# Altium schematic sheet 03_10_POWER_INPUT.SchDoc
size 289 x 400 mm
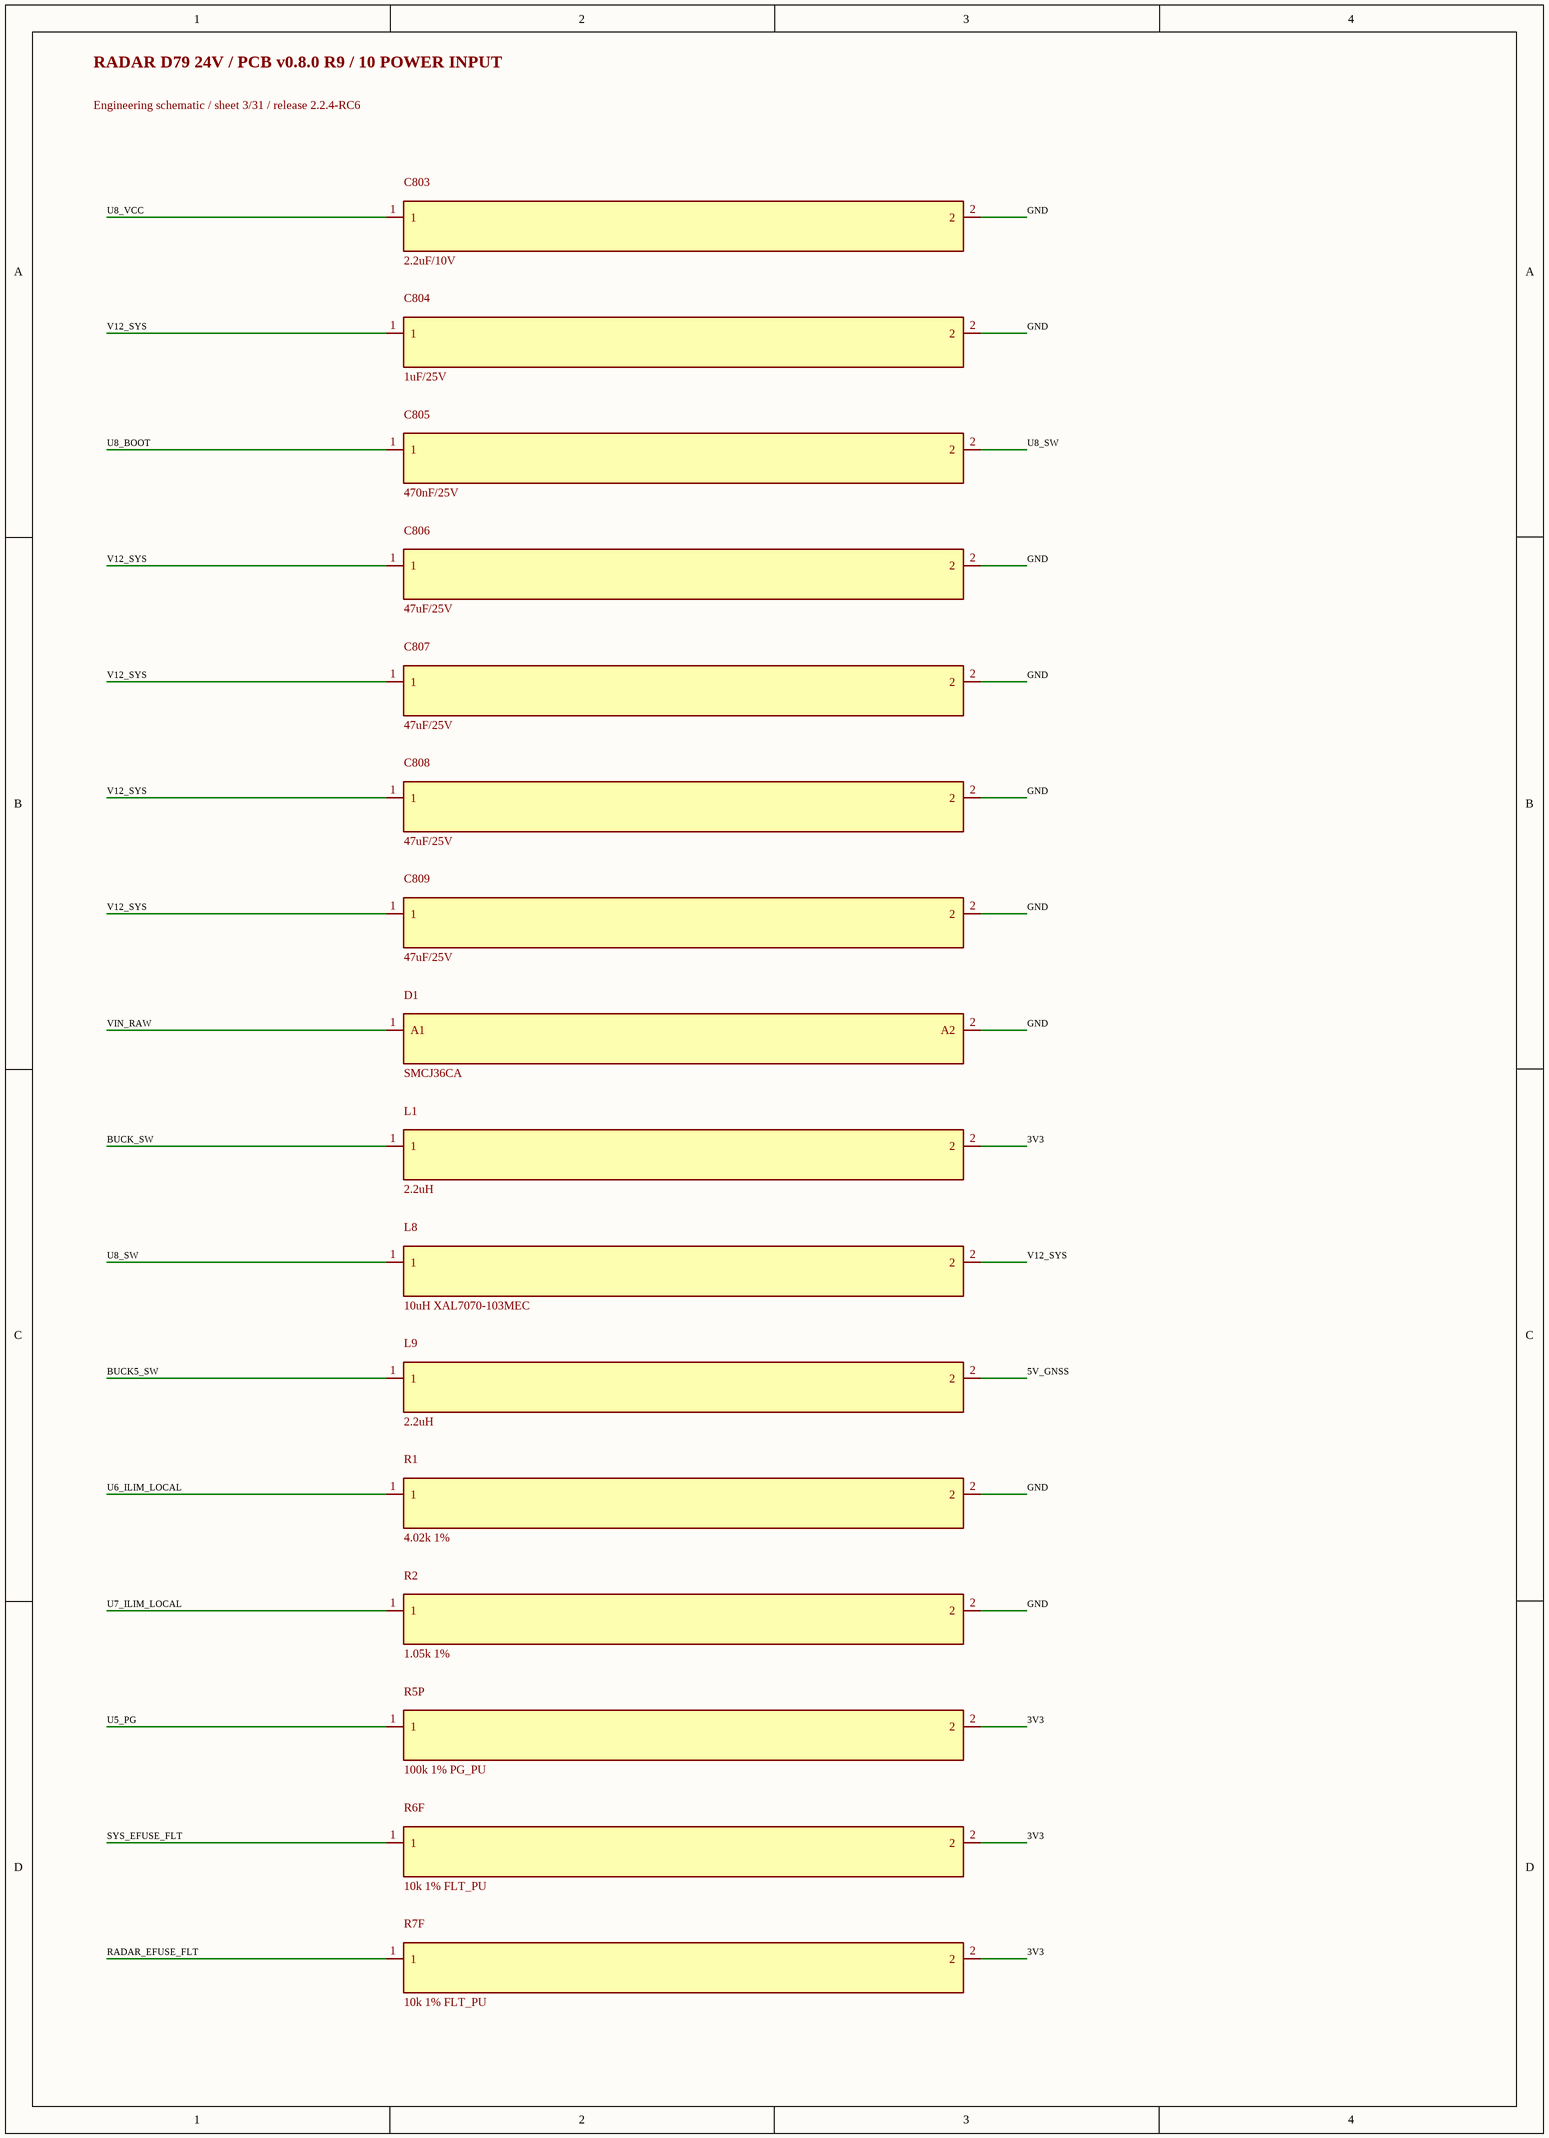
[diagram p0: 03_10_POWER_INPUT.SchDoc]

## Parts
C803  2.2uF/10V  [C_0603_1608Metric]
C804  1uF/25V  [C_0603_1608Metric]
C805  470nF/25V  [C_0603_1608Metric]
C806  47uF/25V  [C_1210_3225Metric]
C807  47uF/25V  [C_1210_3225Metric]
C808  47uF/25V  [C_1210_3225Metric]
C809  47uF/25V  [C_1210_3225Metric]
D1  SMCJ36CA  [D_SMC]
L1  2.2uH  [Coilcraft_XFL4020_4x4]
L8  10uH XAL7070-103MEC  [L_Coilcraft_XAL7070-XXX]
L9  2.2uH  [Coilcraft_XFL4020_4x4]
R1  4.02k 1%  [R_0603_1608Metric]
R2  1.05k 1%  [R_0603_1608Metric]
R5P  100k 1% PG_PU  [R_0603_1608Metric]
R6F  10k 1% FLT_PU  [R_0603_1608Metric]
R7F  10k 1% FLT_PU  [R_0603_1608Metric]

## Nets
3V3: L1.2 R5P.2 R6F.2 R7F.2
5V_GNSS: L9.2
BUCK5_SW: L9.1
BUCK_SW: L1.1
GND: C803.2 C804.2 C806.2 C807.2 C808.2 C809.2 D1.2(A2) R1.2 R2.2
RADAR_EFUSE_FLT: R7F.1
SYS_EFUSE_FLT: R6F.1
U5_PG: R5P.1
U6_ILIM_LOCAL: R1.1
U7_ILIM_LOCAL: R2.1
U8_BOOT: C805.1
U8_SW: C805.2 L8.1
U8_VCC: C803.1
V12_SYS: C804.1 C806.1 C807.1 C808.1 C809.1 L8.2
VIN_RAW: D1.1(A1)

## Notes on the sheet
- RADAR D79 24V / PCB v0.8.0 R9 / 10 POWER INPUT
- Engineering schematic / sheet 3/31 / release 2.2.4-RC6